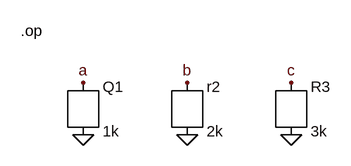
[diagram p0: schematic naming.asc]
naming.asc, the LTspice schematic file:
Version 4
SHEET 1 800 600
FLAG 112 112 a
FLAG 112 192 0
FLAG 272 112 b
FLAG 272 192 0
FLAG 432 112 c
FLAG 432 192 0
SYMBOL res 96 96 R0
SYMATTR InstName Q1
SYMATTR Value 1k
SYMBOL res 256 96 R0
SYMATTR InstName r2
SYMATTR Value 2k
SYMBOL res 416 96 R0
SYMATTR InstName R3
SYMATTR Value 3k
TEXT 16 32 Left 2 !.op

The netlist it stands for:
* naming.asc
R§Q1 a 0 1k
r2 b 0 2k
R3 c 0 3k
.op
.backanno
.end